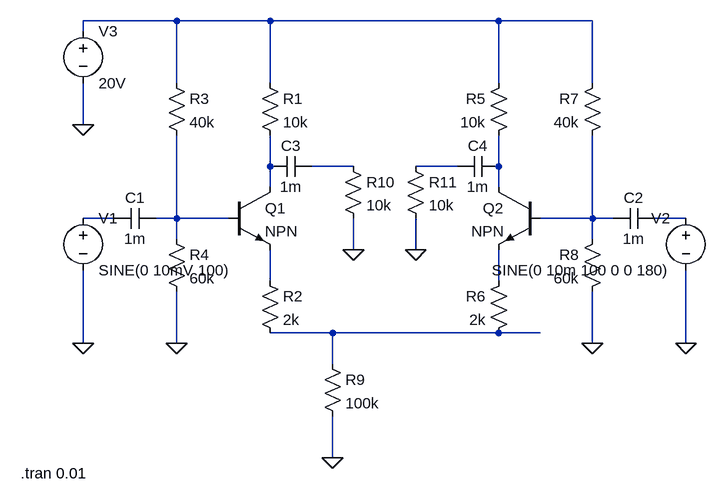
[diagram p0: schematic 03 AD_1_cu_Ro - V2y.asc]
03 AD_1_cu_Ro - V2y.asc, the LTspice schematic file:
Version 4
SHEET 1 880 680
WIRE -48 -176 -192 -176
WIRE 96 -176 -48 -176
WIRE 448 -176 96 -176
WIRE 592 -176 448 -176
WIRE -192 -160 -192 -176
WIRE -48 -80 -48 -176
WIRE 96 -80 96 -176
WIRE 448 -80 448 -176
WIRE 592 -80 592 -176
WIRE -192 -16 -192 -80
WIRE 96 48 96 0
WIRE 224 48 160 48
WIRE 384 48 320 48
WIRE 448 48 448 0
WIRE 96 80 96 48
WIRE 448 80 448 48
WIRE -144 128 -192 128
WIRE -48 128 -48 0
WIRE -48 128 -80 128
WIRE 32 128 -48 128
WIRE 592 128 592 0
WIRE 592 128 512 128
WIRE 624 128 592 128
WIRE 736 128 688 128
WIRE -48 160 -48 128
WIRE 592 160 592 128
WIRE 224 176 224 128
WIRE 320 176 320 128
WIRE 96 224 96 176
WIRE 448 224 448 176
WIRE 192 304 96 304
WIRE 448 304 192 304
WIRE 512 304 448 304
WIRE -192 320 -192 208
WIRE -48 320 -48 240
WIRE 592 320 592 240
WIRE 736 320 736 208
WIRE 192 352 192 304
WIRE 192 496 192 432
FLAG -48 320 0
FLAG -192 320 0
FLAG 592 320 0
FLAG 736 320 0
FLAG 192 496 0
FLAG -192 -16 0
FLAG 224 176 0
FLAG 320 176 0
SYMBOL npn 32 80 R0
SYMATTR InstName Q1
SYMBOL res 80 -96 R0
SYMATTR InstName R1
SYMATTR Value 10k
SYMBOL res 80 208 R0
SYMATTR InstName R2
SYMATTR Value 2k
SYMBOL res -64 -96 R0
SYMATTR InstName R3
SYMATTR Value 40k
SYMBOL res -64 144 R0
SYMATTR InstName R4
SYMATTR Value 60k
SYMBOL cap -80 112 R90
WINDOW 0 0 32 VBottom 2
WINDOW 3 32 32 VTop 2
SYMATTR InstName C1
SYMATTR Value 1m
SYMBOL voltage -192 112 R0
WINDOW 123 0 0 Left 2
WINDOW 39 0 0 Left 2
SYMATTR InstName V1
SYMATTR Value SINE(0 10mV 100)
SYMBOL npn 512 80 M0
SYMATTR InstName Q2
SYMBOL res 464 -96 M0
SYMATTR InstName R5
SYMATTR Value 10k
SYMBOL res 464 208 M0
SYMATTR InstName R6
SYMATTR Value 2k
SYMBOL res 608 -96 M0
SYMATTR InstName R7
SYMATTR Value 40k
SYMBOL res 608 144 M0
SYMATTR InstName R8
SYMATTR Value 60k
SYMBOL cap 624 112 M90
WINDOW 0 0 32 VBottom 2
WINDOW 3 32 32 VTop 2
SYMATTR InstName C2
SYMATTR Value 1m
SYMBOL voltage 736 112 M0
WINDOW 123 0 0 Left 2
WINDOW 39 0 0 Left 2
SYMATTR InstName V2
SYMATTR Value SINE(0 10m 100 0 0 180)
SYMBOL res 176 336 R0
SYMATTR InstName R9
SYMATTR Value 100k
SYMBOL voltage -192 -176 R0
WINDOW 123 0 0 Left 2
WINDOW 39 0 0 Left 2
SYMATTR InstName V3
SYMATTR Value 20V
SYMBOL cap 160 32 R90
WINDOW 0 0 32 VBottom 2
WINDOW 3 32 32 VTop 2
SYMATTR InstName C3
SYMATTR Value 1m
SYMBOL res 208 32 R0
SYMATTR InstName R10
SYMATTR Value 10k
SYMBOL cap 448 32 R90
WINDOW 0 0 32 VBottom 2
WINDOW 3 32 32 VTop 2
SYMATTR InstName C4
SYMATTR Value 1m
SYMBOL res 304 32 R0
SYMATTR InstName R11
SYMATTR Value 10k
TEXT -288 520 Left 2 !.tran 0.01

The netlist it stands for:
* 03 AD_1_cu_Ro - V2y.asc
Q1 N002 N007 N010 0 NPN
R1 N001 N002 10k
R2 N010 N012 2k
R3 N001 N007 40k
R4 N007 0 60k
C1 N007 N006 1m
V1 N006 0 SINE(0 10mV 100)
Q2 N005 N008 N011 0 NPN
R5 N001 N005 10k
R6 N011 N012 2k
R7 N001 N008 40k
R8 N008 0 60k
C2 N008 N009 1m
V2 N009 0 SINE(0 10m 100 0 0 180)
R9 N012 0 100k
V3 N001 0 20V
C3 N003 N002 1m
R10 N003 0 10k
C4 N005 N004 1m
R11 N004 0 10k
.model NPN NPN
.model PNP PNP
.lib standard.bjt
.tran 0.01
.backanno
.end